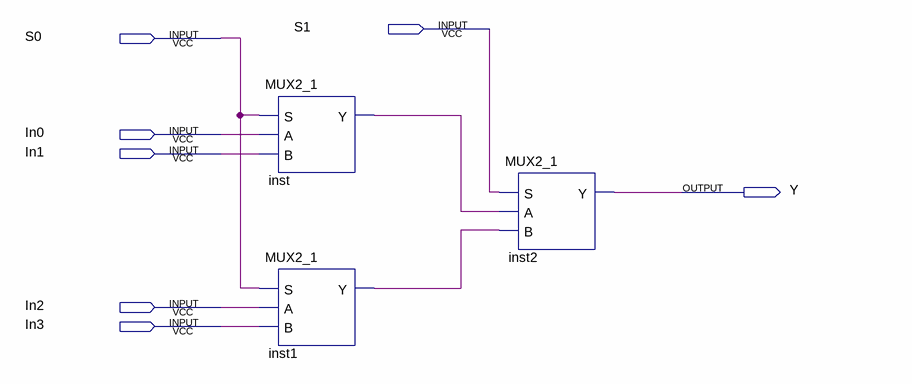
[diagram p0: schematic sheet]
// Quartus schematic MUX4_1_data_1_bit.bdf as structural Verilog: 3 symbols, 7 pins
module MUX4_1_data_1_bit (
  input  S1,
  input  S0,
  input  In0,
  input  In1,
  input  In2,
  input  In3,
  output Y
);

  wire inst1_y, inst_y;

  MUX2_1 inst (.S(S0), .A(In0), .B(In1), .Y(inst_y));
  MUX2_1 inst1 (.S(S0), .A(In2), .B(In3), .Y(inst1_y));
  MUX2_1 inst2 (.S(S1), .A(inst_y), .B(inst1_y), .Y(Y));
endmodule
